# Altium project Sandbox.PrjPcb
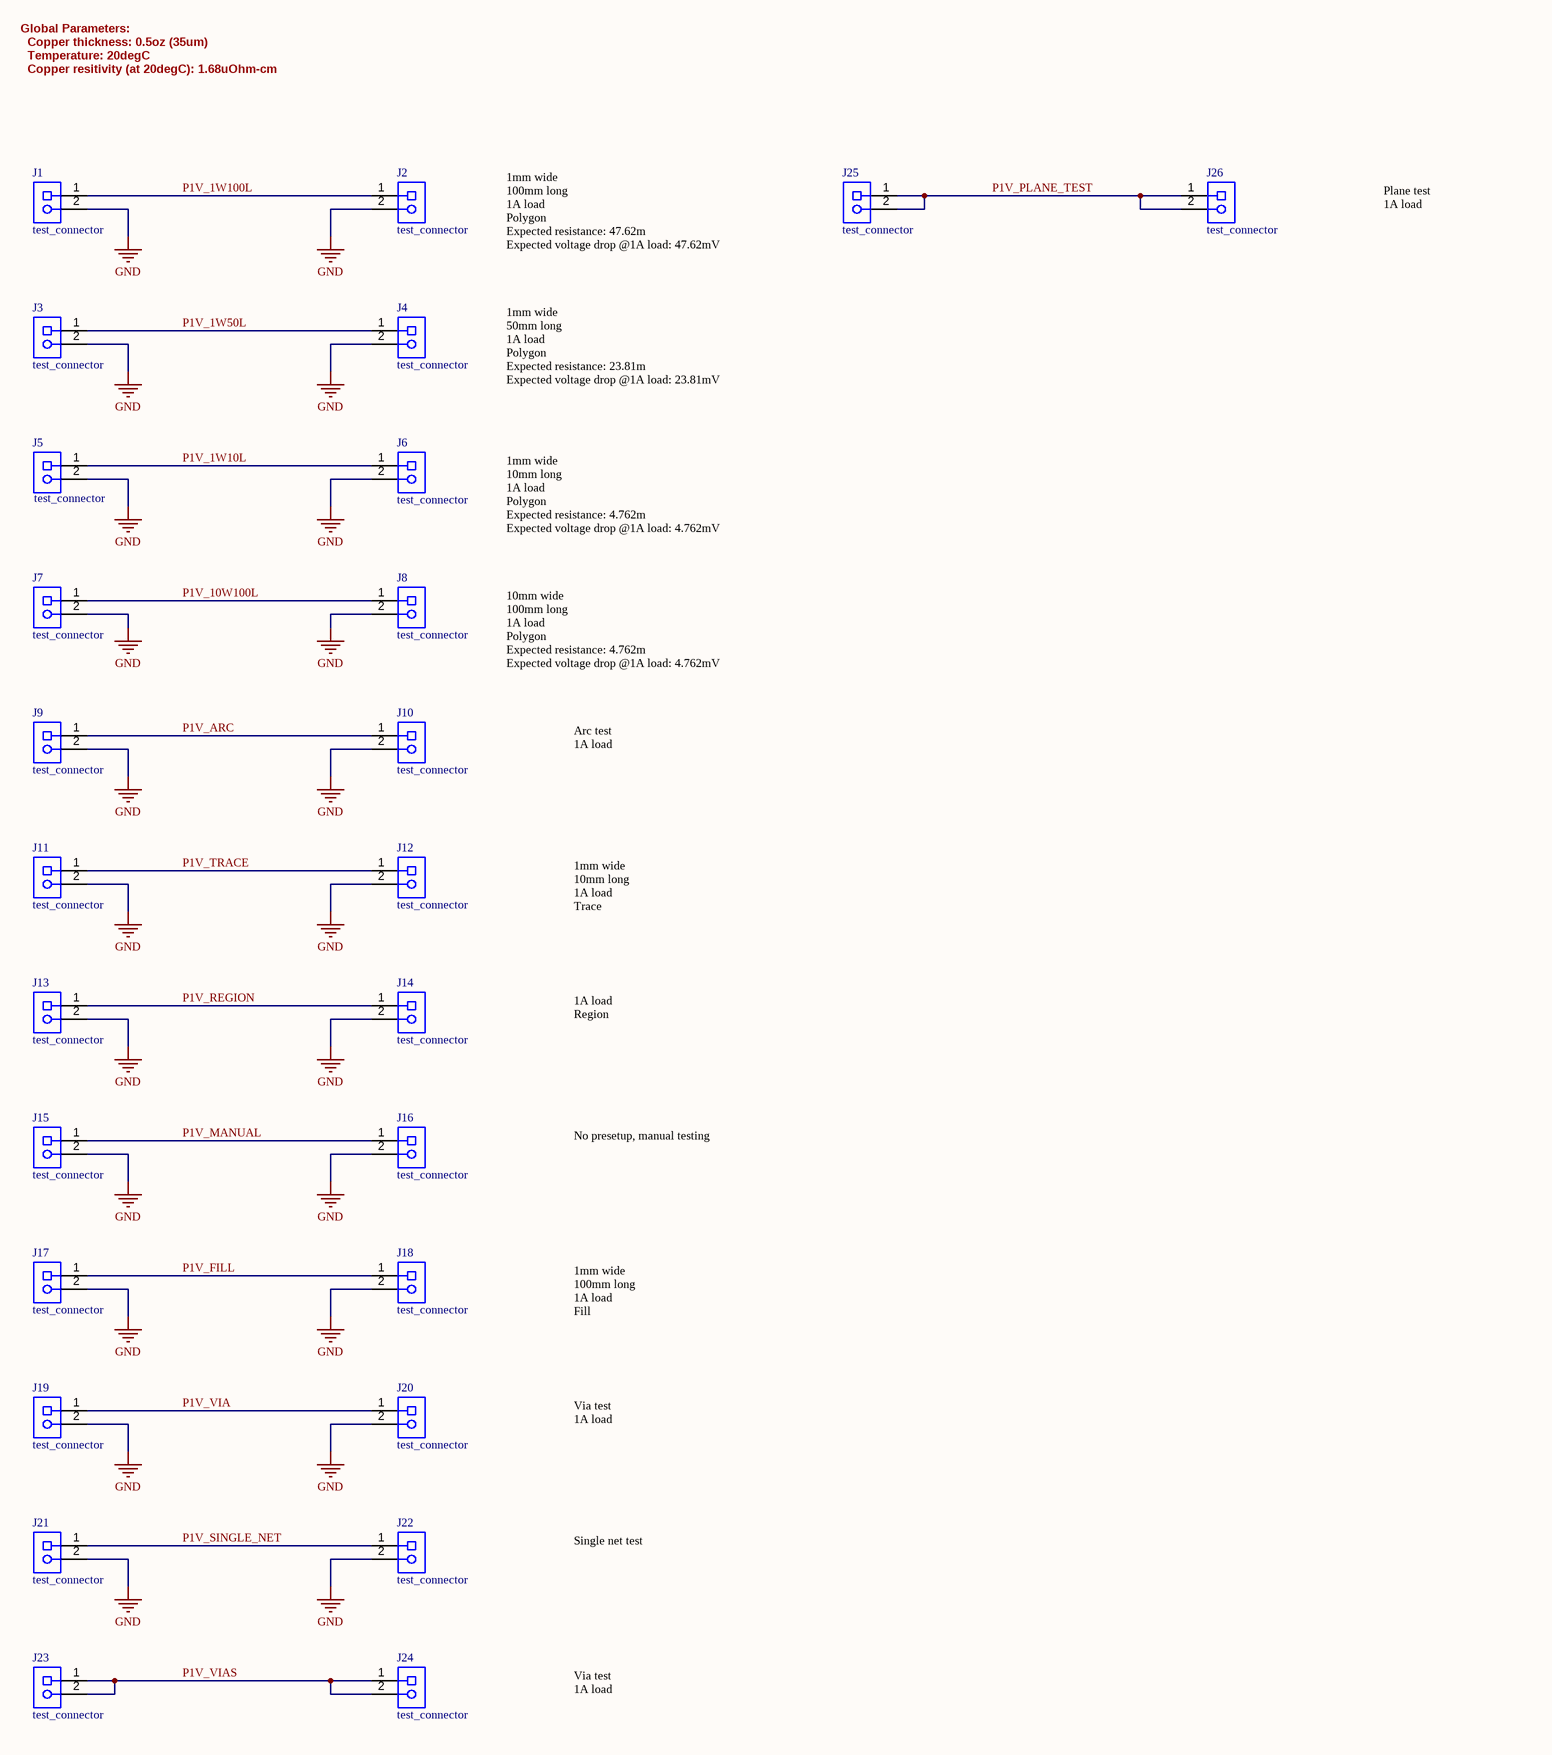
[diagram p0: Main.SchDoc]
1 sheet, 26 parts. Net scope: global (net labels, ports and power ports of the same name join across sheets).
Board file: Sandbox.PcbDoc

## Sheet Main.SchDoc
size A2; ENG_APP_DATE: --/--/--; DSN_APP_DATE: --/--/--; CHK_APP_DATE: --/--/--; SheetNumber: 1; SheetTotal: 1

### Parts
J1  test_connector  [test_connector_footprint]
J2  test_connector  [test_connector_footprint]
J3  test_connector  [test_connector_footprint]
J4  test_connector  [test_connector_footprint]
J5  test_connector  [test_connector_footprint]
J6  test_connector  [test_connector_footprint]
J7  test_connector  [test_connector_footprint]
J8  test_connector  [test_connector_footprint]
J9  test_connector  [test_connector_footprint]
J10  test_connector  [test_connector_footprint]
J11  test_connector  [test_connector_footprint]
J12  test_connector  [test_connector_footprint]
J13  test_connector  [test_connector_footprint]
J14  test_connector  [test_connector_footprint]
J15  test_connector  [test_connector_footprint]
J16  test_connector  [test_connector_footprint]
J17  test_connector  [test_connector_footprint]
J18  test_connector  [test_connector_footprint]
J19  test_connector  [test_connector_footprint]
J20  test_connector  [test_connector_footprint]
J21  test_connector  [test_connector_footprint]
J22  test_connector  [test_connector_footprint]
J23  test_connector  [test_connector_footprint]
J24  test_connector  [test_connector_footprint]
J25  test_connector  [test_connector_footprint]
J26  test_connector  [test_connector_footprint]

### Nets
GND: J1.2 J2.2 J3.2 J4.2 J5.2 J6.2 J7.2 J8.2 J9.2 J10.2 J11.2 J12.2 J13.2 J14.2 J15.2 J16.2 J17.2 J18.2 J19.2 J20.2 J21.2 J22.2
P1V_1W10L: J5.1 J6.1
P1V_1W50L: J3.1 J4.1
P1V_1W100L: J1.1 J2.1
P1V_10W100L: J7.1 J8.1
P1V_ARC: J9.1 J10.1
P1V_FILL: J17.1 J18.1
P1V_MANUAL: J15.1 J16.1
P1V_PLANE_TEST: J25.1 J25.2 J26.1 J26.2
P1V_REGION: J13.1 J14.1
P1V_SINGLE_NET: J21.1 J22.1
P1V_TRACE: J11.1 J12.1
P1V_VIA: J19.1 J20.1
P1V_VIAS: J23.1 J23.2 J24.1 J24.2

### Notes on the sheet
- Global Parameters:
  Copper thickness: 0.5oz (35um)
  Temperature: 20degC
  Copper resitivity (at 20degC): 1.68uOhm-cm
- 1mm wide
  100mm long
  1A load
  Polygon
  Expected resistance: 47.62m
  Expected voltage drop @1A load: 47.62mV
- Plane test
  1A load
- 1mm wide
  50mm long
  1A load
  Polygon
  Expected resistance: 23.81m
  Expected voltage drop @1A load: 23.81mV
- 1mm wide
  10mm long
  1A load
  Polygon
  Expected resistance: 4.762m
  Expected voltage drop @1A load: 4.762mV
- 10mm wide
  100mm long
  1A load
  Polygon
  Expected resistance: 4.762m
  Expected voltage drop @1A load: 4.762mV
- Arc test
  1A load
- 1mm wide
  10mm long
  1A load
  Trace
- 1A load
  Region
- No presetup, manual testing
- 1mm wide
  100mm long
  1A load
  Fill
- Via test
  1A load
- Single net test
- DWG NO:
- REV:
- THIS DOCUMENT AND THE DATA DISCLOSED HEREIN OR
- HEREWITH IS THE PROPERTY OF ALTIUM LIMITED AND MAY
- BE FREELY DISTRIBUTED IN WHOLE. NO RIGHTS ARE
- RESERVED OR EXPRESS OR IMPLIED WARANTEE GIVEN.
- REVISION
- DESCRIPTION
- DATE
- APPROVED
- ENG:
- APPROVALS
- PROJECT
- DSN:
- CHK:
- REFERENCE DOCUMENTS
- PROJECT REVISION:
- TITLE
- DOCUMENT REVISION:
- DESIGN ITEM:
- BOM:
- FAB DWG:
- PCB DWG:
- ASSY DWG:
- SCALE:
- A2
- SIZE
- CAGE CODE
- FILE NAME
- DWG NO.
- SHEET
- OF
- REV

### Library data of the parts
J1 = test_conn: for playing around with; Manufacturer: Phoenix Contact; Manufacturer Part Number: 1729128; PDN_ROLE: SOURCE; PDN_P_NET: P1V_1W100L; PDN_N_NET: GND; PDN_V: 1; Component Type: Connectors
J2 = test_conn: for playing around with; Manufacturer: Phoenix Contact; Manufacturer Part Number: 1729128; PDN_ROLE: SINK; PDN_I: 1; PDN_P_NET: P1V_1W100L; PDN_N_NET: GND; Component Type: Connectors
J3 = test_conn: for playing around with; Manufacturer: Phoenix Contact; Manufacturer Part Number: 1729128; PDN_ROLE: SOURCE; PDN_P_NET: P1V_1W50L; PDN_N_NET: GND; PDN_V: 1; Component Type: Connectors
J4 = test_conn: for playing around with; Manufacturer: Phoenix Contact; Manufacturer Part Number: 1729128; PDN_ROLE: SINK; PDN_I: 1; PDN_P_NET: P1V_1W50L; PDN_N_NET: GND; Component Type: Connectors
J5 = test_conn: for playing around with; Manufacturer: Phoenix Contact; Manufacturer Part Number: 1729128; PDN_ROLE: SOURCE; PDN_P_NET: P1V_1W10L; PDN_N_NET: GND; PDN_V: 1; Component Type: Connectors
J6 = test_conn: for playing around with; Manufacturer: Phoenix Contact; Manufacturer Part Number: 1729128; PDN_ROLE: SINK; PDN_I: 1; PDN_P_NET: P1V_1W10L; PDN_N_NET: GND; Component Type: Connectors
J7 = test_conn: for playing around with; Manufacturer: Phoenix Contact; Manufacturer Part Number: 1729128; PDN_ROLE: SOURCE; PDN_P_NET: P1V_10W100L; PDN_N_NET: GND; PDN_V: 1; Component Type: Connectors
J8 = test_conn: for playing around with; Manufacturer: Phoenix Contact; Manufacturer Part Number: 1729128; PDN_ROLE: SINK; PDN_I: 1; PDN_P_NET: P1V_10W100L; PDN_N_NET: GND; Component Type: Connectors
J9 = test_conn: for playing around with; Manufacturer: Phoenix Contact; Manufacturer Part Number: 1729128; PDN_ROLE: SOURCE; PDN_P_NET: P1V_ARC; PDN_N_NET: GND; PDN_V: 1; Component Type: Connectors
J10 = test_conn: for playing around with; Manufacturer: Phoenix Contact; Manufacturer Part Number: 1729128; PDN_ROLE: SINK; PDN_I: 1; PDN_P_NET: P1V_ARC; PDN_N_NET: GND; PDN_MIN_V: 0.95; Component Type: Connectors
J11 = test_conn: for playing around with; Manufacturer: Phoenix Contact; Manufacturer Part Number: 1729128; PDN_ROLE: SOURCE; PDN_P_NET: P1V_TRACE; PDN_N_NET: GND; PDN_V: 1; Component Type: Connectors
J12 = test_conn: for playing around with; Manufacturer: Phoenix Contact; Manufacturer Part Number: 1729128; PDN_ROLE: SINK; PDN_I: 1; PDN_P_NET: P1V_TRACE; PDN_N_NET: GND; Component Type: Connectors
J13 = test_conn: for playing around with; Manufacturer: Phoenix Contact; Manufacturer Part Number: 1729128; PDN_ROLE: SOURCE; PDN_P_NET: P1V_REGION; PDN_N_NET: GND; PDN_V: 1; Component Type: Connectors
J14 = test_conn: for playing around with; Manufacturer: Phoenix Contact; Manufacturer Part Number: 1729128; PDN_ROLE: SINK; PDN_I: 1; PDN_P_NET: P1V_REGION; PDN_N_NET: GND; Component Type: Connectors
J15 J16 = test_conn: for playing around with; Manufacturer: Phoenix Contact; Manufacturer Part Number: 1729128; Component Type: Connectors
J17 = test_conn: for playing around with; Manufacturer: Phoenix Contact; Manufacturer Part Number: 1729128; PDN_ROLE: SOURCE; PDN_P_NET: P1V_FILL; PDN_N_NET: GND; PDN_V: 1; Component Type: Connectors
J18 = test_conn: for playing around with; Manufacturer: Phoenix Contact; Manufacturer Part Number: 1729128; PDN_ROLE: SINK; PDN_I: 1; PDN_P_NET: P1V_FILL; PDN_N_NET: GND; Component Type: Connectors
J19 = test_conn: for playing around with; Manufacturer: Phoenix Contact; Manufacturer Part Number: 1729128; PDN_ROLE: SOURCE; PDN_P_NET: P1V_VIA; PDN_N_NET: GND; PDN_V: 1; Component Type: Connectors
J20 = test_conn: for playing around with; Manufacturer: Phoenix Contact; Manufacturer Part Number: 1729128; PDN_ROLE: SINK; PDN_I: 1; PDN_P_NET: P1V_VIA; PDN_N_NET: GND; Component Type: Connectors
J21 = test_conn: for playing around with; Manufacturer: Phoenix Contact; Manufacturer Part Number: 1729128; PDN_ROLE: SOURCE; PDN_NET: P1V_SINGLE_NET; PDN_V: 1; Component Type: Connectors
J22 = test_conn: for playing around with; Manufacturer: Phoenix Contact; Manufacturer Part Number: 1729128; PDN_ROLE: SINK; PDN_I: 1; PDN_NET: P1V_SINGLE_NET; Component Type: Connectors
J23 J25 = test_conn: for playing around with; Manufacturer: Phoenix Contact; Manufacturer Part Number: 1729128; PDN_ROLE: SOURCE; PDN_PINS: 1; Component Type: Connectors; PDN_V: 1
J24 = test_conn: for playing around with; Manufacturer: Phoenix Contact; Manufacturer Part Number: 1729128; PDN_ROLE: SINK; PDN_I: 1; PDN_NET: P1V_VIAS; Component Type: Connectors
J26 = test_conn: for playing around with; Manufacturer: Phoenix Contact; Manufacturer Part Number: 1729128; PDN_ROLE: SINK; PDN_I: 1; PDN_NET: P1V_PLANE_TEST; Component Type: Connectors

## Assembly variants
Bringup: all parts fitted